# Altium project Brendon_STM32-v1.1.PrjPcb (part 2 of 2)

## Sheet Peripheral_Sheet.SchDoc
size A4; DocumentNumber: 4; SheetNumber: 4; SheetTotal: 4
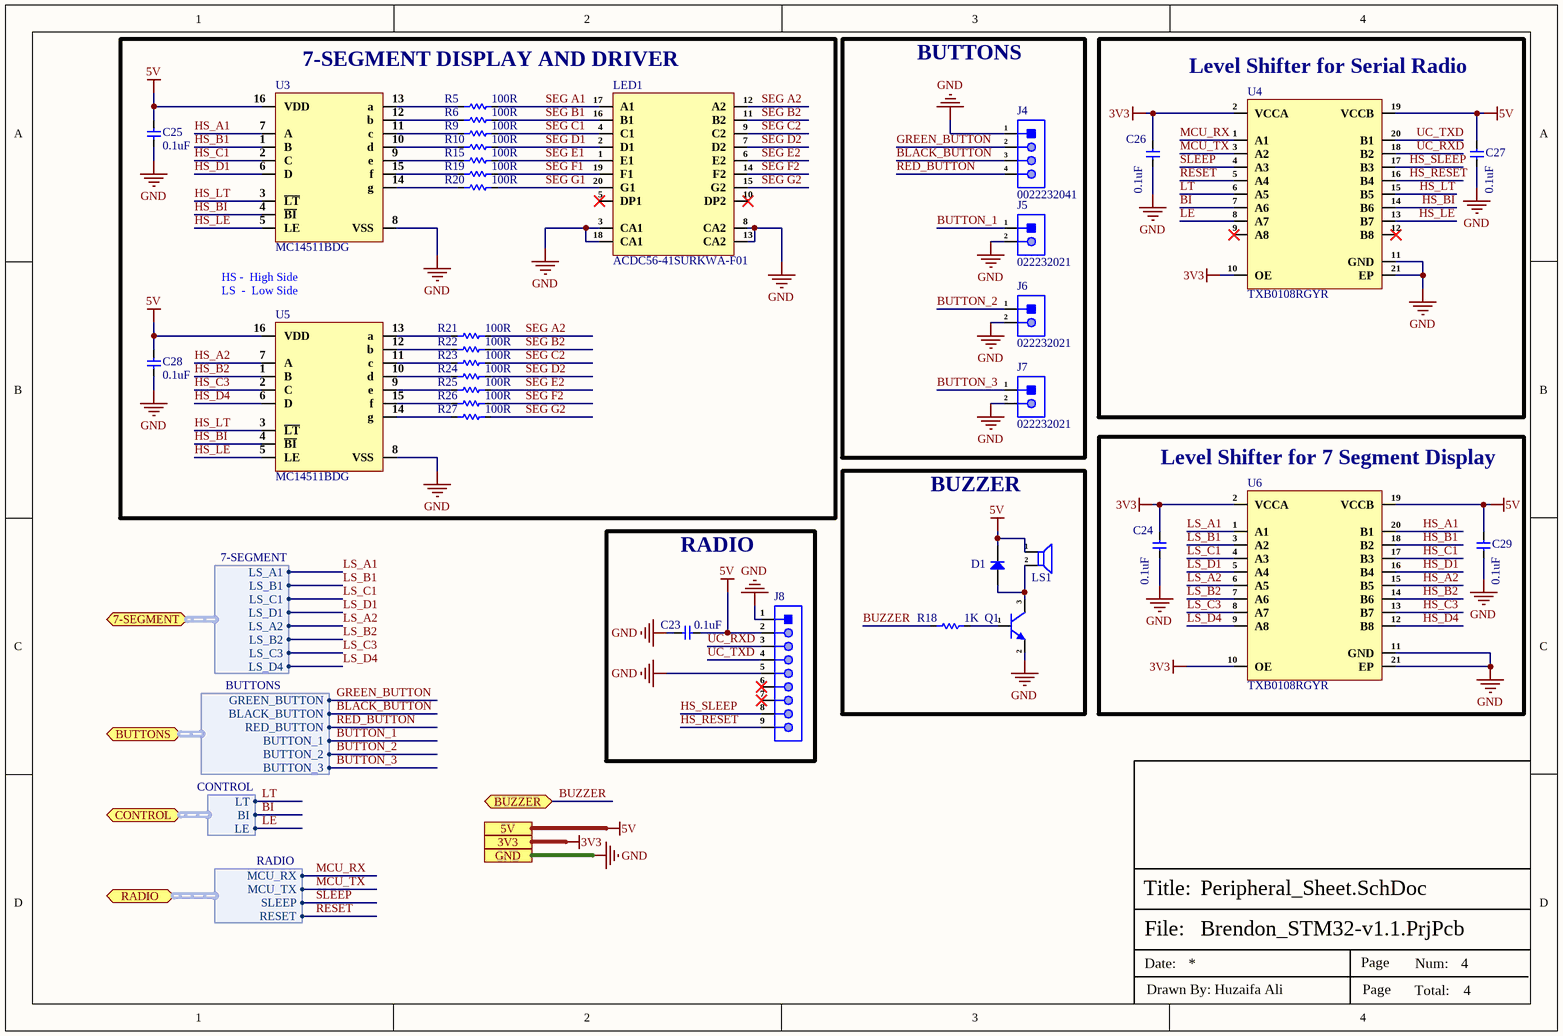
[diagram p2: Peripheral_Sheet.SchDoc]

### Parts
C23  0.1uF  [Cap-0805]
C24  0.1uF  [Cap-0805]
C25  0.1uF  [Cap-0805]
C26  0.1uF  [Cap-0805]
C27  0.1uF  [Cap-0805]
C28  0.1uF  [Cap-0805]
C29  0.1uF  [Cap-0805]
D1  MURS120-E3/5BT  [DO-214AA (SMB)]  (value not drawn)
J4  0022232041  [0022232041]
J5  022232021  [022232021]
J6  022232021  [022232021]
J7  022232021  [022232021]
J8  PPTC091LGBN-RC  [HDR 1x9 Female R/A]  (value not drawn)
LED1  ACDC56-41SURKWA-F01  [ACDC56-41SURKWA-F01]
LS1  CT-1205CL-SMT-TR  [CT-1205CL-SMT-TR]  (value not drawn)
Q1  BC849C-TP  [SOT-23]  (value not drawn)
R5  100R  [Res-0603]
R6  100R  [Res-0603]
R9  100R  [Res-0603]
R10  100R  [Res-0603]
R15  100R  [Res-0603]
R18  1K  [RES-0805]
R19  100R  [Res-0603]
R20  100R  [Res-0603]
R21  100R  [Res-0603]
R22  100R  [Res-0603]
R23  100R  [Res-0603]
R24  100R  [Res-0603]
R25  100R  [Res-0603]
R26  100R  [Res-0603]
R27  100R  [Res-0603]
U3  MC14511BDG  [16-SOIC (0.154", 3.90mm Width)]
U4  TXB0108RGYR  [20-VFQFN Exposed Pad]
U5  MC14511BDG  [16-SOIC (0.154", 3.90mm Width)]
U6  TXB0108RGYR  [20-VFQFN Exposed Pad]

### Blocks framed on the sheet
7-SEGMENT DISPLAY AND DRIVER: C25 C28 LED1 R5 R6 R9 R10 R15 R19-R27 U3 U5
BUTTONS: J4-J7
Level Shifter for Serial Radio: C26 C27 U4
Level Shifter for 7 Segment Display: C24 C29 U6
BUZZER: D1 LS1 Q1 R18
RADIO: C23 J8

### Ports
3V3 (see Top_Sheet[3B], Controller_Sheet[1D], Power_Sheet[1C]), 5V (see Top_Sheet[3B], Controller_Sheet[1D], Power_Sheet[1C]), 7-SEGMENT (bidir, harness 7-SEGMENT, see Top_Sheet[3B], Controller_Sheet[1C]), BUTTONS (bidir, harness BUTTONS, see Top_Sheet[3B], Controller_Sheet[1D]), BUZZER (bidir, see Top_Sheet[3C], Controller_Sheet[1D]), CONTROL (bidir, harness CONTROL, see Top_Sheet[3C], Controller_Sheet[1C]), GND (see Top_Sheet[3C], Controller_Sheet[1D], Power_Sheet[1C]), RADIO (bidir, harness RADIO, see Top_Sheet[3B], Controller_Sheet[1D])

### Harnesses
BUTTONS: GREEN_BUTTON, BLACK_BUTTON, RED_BUTTON, BUTTON_1, BUTTON_2, BUTTON_3
RADIO: MCU_RX, MCU_TX, SLEEP, RESET
7-SEGMENT: LS_A1, LS_B1, LS_C1, LS_D1, LS_A2, LS_B2, LS_C3, LS_D4
CONTROL: LT, BI, LE

### Nets
3V3: C24.2 C26.2 U4.2(VCCA) U4.10(OE) U6.2(VCCA) U6.10(OE) ; port 3V3
5V: C23.1 C25.2 C27.2 C28.2 C29.2 D1.1(K) J8.2 LS1.1 U3.16(VDD) U4.19(VCCB) U5.16(VDD) U6.19(VCCB) ; port 5V
GND: C23.2 C24.1 C25.1 C26.1 C27.1 C28.1 C29.1 J4.1 J5.2 J6.2 J7.2 J8.1 J8.5 LED1.3(CA1) LED1.8(CA2) LED1.13(CA2) LED1.18(CA1) Q1.2(E) U3.8(VSS) U4.11(GND) U4.21(EP) U5.8(VSS) U6.11(GND) U6.21(EP) ; port GND
BI: U4.7(A6) ; port CONTROL.BI
BLACK_BUTTON: J4.3 ; port BUTTONS.BLACK_BUTTON
BUTTON_1: J5.1 ; port BUTTONS.BUTTON_1
BUTTON_2: J6.1 ; port BUTTONS.BUTTON_2
BUTTON_3: J7.1 ; port BUTTONS.BUTTON_3
BUZZER: R18.1 ; port BUZZER
GREEN_BUTTON: J4.2 ; port BUTTONS.GREEN_BUTTON
HS_A1: U3.7(A) U6.20(B1)
HS_A2: U5.7(A) U6.15(B5)
HS_B1: U3.1(B) U6.18(B2)
HS_B2: U5.1(B) U6.14(B6)
HS_BI: U3.4(~{BI}) U4.14(B6) U5.4(~{BI})
HS_C1: U3.2(C) U6.17(B3)
HS_C3: U5.2(C) U6.13(B7)
HS_D1: U3.6(D) U6.16(B4)
HS_D4: U5.6(D) U6.12(B8)
HS_LE: U3.5(LE) U4.13(B7) U5.5(LE)
HS_LT: U3.3(~{LT}) U4.15(B5) U5.3(~{LT})
HS_RESET: J8.9 U4.16(B4)
HS_SLEEP: J8.8 U4.17(B3)
LE: U4.8(A7) ; port CONTROL.LE
LS_A1: U6.1(A1) ; port 7-SEGMENT.LS_A1
LS_A2: U6.6(A5) ; port 7-SEGMENT.LS_A2
LS_B1: U6.3(A2) ; port 7-SEGMENT.LS_B1
LS_B2: U6.7(A6) ; port 7-SEGMENT.LS_B2
LS_C1: U6.4(A3) ; port 7-SEGMENT.LS_C1
LS_C3: U6.8(A7) ; port 7-SEGMENT.LS_C3
LS_D1: U6.5(A4) ; port 7-SEGMENT.LS_D1
LS_D4: U6.9(A8) ; port 7-SEGMENT.LS_D4
LT: U4.6(A5) ; port CONTROL.LT
MCU_RX: U4.1(A1) ; port RADIO.MCU_RX
MCU_TX: U4.3(A2) ; port RADIO.MCU_TX
RED_BUTTON: J4.4 ; port BUTTONS.RED_BUTTON
RESET: U4.5(A4) ; port RADIO.RESET
SEG A1: LED1.17(A1) R5.2
SEG A2: LED1.12(A2) R21.2
SEG B1: LED1.16(B1) R6.2
SEG B2: LED1.11(B2) R22.2
SEG C1: LED1.4(C1) R9.2
SEG C2: LED1.9(C2) R23.2
SEG D1: LED1.2(D1) R10.2
SEG D2: LED1.7(D2) R24.2
SEG E1: LED1.1(E1) R15.2
SEG E2: LED1.6(E2) R25.2
SEG F1: LED1.19(F1) R19.2
SEG F2: LED1.14(F2) R26.2
SEG G1: LED1.20(G1) R20.2
SEG G2: LED1.15(G2) R27.2
SLEEP: U4.4(A3) ; port RADIO.SLEEP
UC_RXD: J8.3 U4.18(B2)
UC_TXD: J8.4 U4.20(B1)
NetD1_2: D1.2(A) LS1.2 Q1.3(C)
NetQ1_1: Q1.1(B) R18.2
NetR5_1: R5.1 U3.13(a)
NetR6_1: R6.1 U3.12(b)
NetR9_1: R9.1 U3.11(c)
NetR10_1: R10.1 U3.10(d)
NetR15_1: R15.1 U3.9(e)
NetR19_1: R19.1 U3.15(f)
NetR20_1: R20.1 U3.14(g)
NetR21_1: R21.1 U5.13(a)
NetR22_1: R22.1 U5.12(b)
NetR23_1: R23.1 U5.11(c)
NetR24_1: R24.1 U5.10(d)
NetR25_1: R25.1 U5.9(e)
NetR26_1: R26.1 U5.15(f)
NetR27_1: R27.1 U5.14(g)

Not connected (* = marked no-connect by the designer): J8 6* 7*; LED1 5(DP1)* 10(DP2)*; U4 9(A8)* 12(B8)*

### Notes on the sheet
- HS -  High Side
  LS  -  Low Side
- File:
- Title:
- Date:
- Page
- Num:
- Total:
- Drawn By: Huzaifa Ali

### Library data of the parts
C23-C29 = CL21B104KBCNNNC: Multilayer Ceramic Capacitor, 0.1 uF, 50 V, ± 10%, X7R, 0805 [2012 Metric]; Manufacturer: Samsung; Value: 100nF; Voltage Rating: 50V; Supplier: Digikey; Supplier Part Number: 1276-1003-1-ND; Manufacturer Part Number: CL21B104KBCNNNC; RoHS: Yes; Category: Ceramic Capacitors; Stock: 2193973; Pricing: 1=0.1, 10=0.042, 50=0.024, 100=0.0186, 500=0.01404, 1000=0.01103 (USD); Mounting Technology: Surface Mount; Case/Package: 0805; Case Code (Metric): 2012; Case Code (Imperial): 0805; Material: Ceramic; Min Operating Temperature: -55°C; Max Operating Temperature: 125°C; Tolerance: 10%; Dielectric: X7R; Packaging: Tape and Reel; Voltage: 50V; Series: CL; Construction: Flat; Voltage Rating (DC): 50V; Length: 2mm; Width: 0.049inch; Height: 0.85mm; Depth: 1.25mm; Thickness: 0.037inch; Radiation Hardening: No; RoHS Compliant: Yes; Lead Free: 5697LeadFree; ComponentLink1URL: https://datasheet.ciiva.com/25710/cl21b104kbcnnnc-25710182.pdf?src-supplier=Digikey; ComponentLink1Description: https://datasheet.ciiva.com/25710/cl21b104kbcnnnc-25710182.pdf?src-supplier=Digikey; ComponentLink2URL: https://datasheet.ciiva.com/29199/454152-da-01-en-vs-kondensator-0805-29199814.pdf?src-supplier=Conrad; ComponentLink2Description: https://datasheet.ciiva.com/29199/454152-da-01-en-vs-kondensator-0805-29199814.pdf?src-supplier=Conrad; Item Type: Capacitor
D1 = MURS120-E3/5BT: Rectifier Diode Switching 200V 2A 35ns 2-Pin SMB T/R; Manufacturer: Vishay Semiconductors; Max Reverse Current: 2uA; Max Surge Current: 40A; Current: 1A; Supplier: Digikey; Supplier Part Number: MURS120-E3/5BTGICT-ND; Manufacturer Part Number: MURS120-E3/5BT; RoHS: Yes; Category: Rectifier Diodes; Stock: 22917; Pricing: 1=0.44, 10=0.378, 100=0.2629, 500=0.20524, 1000=0.16682 (USD); Mounting Technology: Surface Mount; Case/Package: SMB; Pins: 2; Min Operating Temperature: -65°C; Max Operating Temperature: 175°C; Packaging: Tape and Reel; Forward Current: 2A; Package Quantity: 3200; Recovery Time: 35ns; Average Rectified Current: 2A; Reverse Recovery Time: 35ns; Max Repetitive Reverse Voltage (Vrrm): 200V; Peak Non-Repetitive Surge Current: 40A; Voltage: 200V; Reverse Voltage: 200V; Max Reverse Voltage (DC): 200V; Series: -; Radiation Hardening: No; RoHS Compliant: Yes; ComponentLink1URL: http://www.mouser.com/ds/2/427/88687-240345.pdf?src-supplier=Mouser; ComponentLink1Description: http://www.mouser.com/ds/2/427/88687-240345.pdf?src-supplier=Mouser; ComponentLink2URL: http://components.arrow.com/part/dataview/42678636S6900221N5680?src-supplier=Arrow+Electronics; ComponentLink2Description: http://components.arrow.com/part/dataview/42678636S6900221N5680?src-supplier=Arrow+Electronics; ComponentLink3URL: http://www.vishay.com/docs/88687/murs120.pdf?src-supplier=Digikey; ComponentLink3Description: http://www.vishay.com/docs/88687/murs120.pdf?src-supplier=Digikey; ComponentLink4URL: http://www.vishay.com/docs/88687/88687.pdf?src-supplier=Avnet; ComponentLink4Description: http://www.vishay.com/docs/88687/88687.pdf?src-supplier=Avnet; Package: DO-214AA (SMB); Item Type: Diode
J4 = 0022232041: CONN HEADER VERT 4POS 2.54MM; Manufacturer: Molex; Item Type: JST Connector; Supplier: Mouser; Supplier Part Number: 538-22-23-2041; Manufacturer Part Number: 0022232041; RoHS: Yes; Stock: 47281; Pricing: 1=0.33, 10=0.215, 50=0.215, 100=0.16, 1000=0.145, 10000=0.13 (USD)
J5-J7 = 022232021: CONN HEADER VERT 2POS 2.54MM; Manufacturer: Molex; Supplier: Mouser; Supplier Part Number: 538-22-23-2021; Manufacturer Part Number: 022232021; RoHS: No; Category: Uncategorized; Stock: 51848; Pricing: 1=0.21, 10=0.127, 50=0.127, 100=0.096, 1000=0.086, 10000=0.073 (USD)
J8 = PPTC091LGBN-RC: CONN HDR 9POS 0.1 TIN PCB R/A; Manufacturer: Sullins; Number of Positions: 9; Connector Type: Header; Voltage Rating: 250V; Item Type: Female Header R/A; Supplier: Digikey; Supplier Part Number: S5445-ND; Manufacturer Part Number: PPTC091LGBN-RC; RoHS: Yes; Category: Headers and Wire Housings; Stock: 254; Pricing: 1=0.74, 10=0.624, 80=0.5605, 440=0.45864, 1000=0.40768, 5000=0.364 (USD); Mounting Technology: Through Hole; Contact Material: Bronze; Housing Color: Black; Housing Material: Plastic; Contact Finish - Mating: TIN; Insulation Color: Black; Insulation Material: Polyester; Contact Shape: Square; Min Operating Temperature: -40°C; Max Operating Temperature: 105°C; Number of Rows: 1; Packaging: Tray; Termination: Solder; Contact Type: Female Socket; Fastening Type: Pull; Series: -; Length: 23.4mm; Width: 8.5mm; Height: 2.4mm; Lead Free: Lead Free; RoHS Compliant: Yes; Flammability Rating: UL94 V-0; ComponentLink1URL: https://media.digikey.com/pdf/Data%20Sheets/Sullins%20PDFs/Female_Headers.100_DS.pdf?src-supplier=Digikey; ComponentLink1Description: https://media.digikey.com/pdf/Data%20Sheets/Sullins%20PDFs/Female_Headers.100_DS.pdf?src-supplier=Digikey
LED1 = ACDC56-41SURKWA-F01: DISPLAY 7SEG 0.56" DBL RED 20SMD; Manufacturer: Kingbright; Item Type: 7-Segment LED; Supplier: Digikey; Supplier Part Number: ACDC56-41SURKWA-F01-ND; Manufacturer Part Number: ACDC56-41SURKWA-F01; RoHS: Yes; Category: LED Displays; Pricing: 2000=2.31795 (USD); ComponentLink1URL: https://datasheet.ciiva.com/12423/acdc56-41surkwa-f01-81627-12423377.pdf?src-supplier=Mouser; ComponentLink1Description: https://datasheet.ciiva.com/12423/acdc56-41surkwa-f01-81627-12423377.pdf?src-supplier=Mouser; ComponentLink2URL: https://datasheet.ciiva.com/2105/acdc56-41surkwa-f01-2105135.pdf?src-supplier=Digikey; ComponentLink2Description: https://datasheet.ciiva.com/2105/acdc56-41surkwa-f01-2105135.pdf?src-supplier=Digikey
LS1 = CT-1205CL-SMT-TR: 12.8 mm, 5 V, 88 dB, 2.4 kHz, Surface Mount (SMT), Driving Circuit, Magnetic Audio Indicator Buzzer; Manufacturer: CUI; Frequency: 2.4kHz; Voltage Rating: 5V; Operating Supply Current: 30mA; Supplier: Digikey; Supplier Part Number: 102-1267-1-ND; Manufacturer Part Number: CT-1205CL-SMT-TR; RoHS: No; Category: Uncategorized; Stock: 58213; Pricing: 1=2.230000, 10=1.848000, 25=1.706400, 50=1.603400, 100=1.504100 (USD); Mounting Technology: Surface Mount; Case/Package: SMD/SMT; Min Operating Temperature: -30°C; Max Operating Temperature: 70°C; Termination: Solder; Package Quantity: 450; Packaging: Tape and Reel; Sensing Method: Magnetic; Length: 12.8mm; Width: 12.8mm; Height: 7.6mm; Lead Free: Lead Free; ComponentLink1URL: http://www.mouser.com/ds/2/670/ct-1205cl-smt-515776.pdf?src-supplier=Mouser; ComponentLink1Description: http://www.mouser.com/ds/2/670/ct-1205cl-smt-515776.pdf?src-supplier=Mouser; ComponentLink2URL: https://www.cui.com/product/resource/digikeypdf/ct-1205cl-smt.pdf?src-supplier=Digikey; ComponentLink2Description: https://www.cui.com/product/resource/digikeypdf/ct-1205cl-smt.pdf?src-supplier=Digikey
Q1 = BC849C-TP: TRANS NPN 30V 0.1A SOT23; Manufacturer: MCC; Frequency: 100MHz; Max Power Dissipation: 225mW; Max Collector Current: 100mA; Emitter Base Voltage (VEBO): 6V; Number of Elements: 1; Collector-emitter Voltage-Max: 500mV; Item Type: Mosfet; Supplier: Arrow Electronics; Supplier Part Number: BC849C-TP; Manufacturer Part Number: BC849C-TP; RoHS: Yes; Category: BJTs; Stock: 3000; Pricing: 3000=0.0323, 9000=0.0245, 24000=0.0235, 45000=0.0216, 99000=0.0186 (USD); Mounting Technology: Surface Mount; Case/Package: SOT-23; Pins: 3; Min Operating Temperature: -55°C; Max Operating Temperature: 150°C; Package Quantity: 1; Collector Emitter Voltage (VCEO): 30V; Packaging: Tape and Reel; Transition Frequency: 100MHz; Collector Emitter Breakdown Voltage: 30V; Max Breakdown Voltage: 30V; Polarity: NPN; Collector Base Voltage (VCBO): 30V; Power Dissipation: 225mW; Gain Bandwidth Product: 100MHz; Series: BC849; Radiation Hardening: No; Lead Free: Lead Free; RoHS Compliant: Yes; Reach SVHC Compliant: Unknown; ComponentLink1URL: https://datasheet.ciiva.com/6362/bc846a-bc849csot-23-6362344.pdf?src-supplier=Digikey; ComponentLink1Description: https://datasheet.ciiva.com/6362/bc846a-bc849csot-23-6362344.pdf?src-supplier=Digikey; ComponentLink2URL: https://datasheet.ciiva.com/6362/bc846a-bc849csot-23-6362345.pdf?src-supplier=Digikey; ComponentLink2Description: https://datasheet.ciiva.com/6362/bc846a-bc849csot-23-6362345.pdf?src-supplier=Digikey; ComponentLink3URL: https://datasheet.ciiva.com/6362/bc846a-bc849csot-23-6362342.pdf?src-supplier=Digikey; ComponentLink3Description: https://datasheet.ciiva.com/6362/bc846a-bc849csot-23-6362342.pdf?src-supplier=Digikey; ComponentLink4URL: https://datasheet.ciiva.com/15200/getdatasheetpartid-334290-15200455.pdf?src-supplier=Verical; ComponentLink4Description: https://datasheet.ciiva.com/15200/getdatasheetpartid-334290-15200455.pdf?src-supplier=Verical
R5 R6 R9 R10 R15 R19-R27 = RC0603FR-07100RL: RES SMD 100 OHM 1% 1/10W 0603; Manufacturer: Yageo; Temperature Coefficient: 100ppm/°C; Voltage Rating (DC): 50V; Power Rating: 100mW; Item Type: Resistor; Supplier 1: Arrow Electronics; Manufacturer Part Number: RC0603FR-07100RL; RoHS: Yes; Category: Chip SMD Resistors; Stock 1: 3800000; Pricing 1: 5000=0.00300, 5000=0.00200, 5000=0.00450, 50000=0.00410, 500000=0.00230, 2500000=0.00140 (USD); Case/Package: 0603; Number of Pins: 2; Case Code (Imperial): 0603; Case Code (Metric): 1608; Size Code: 0603; Min Operating Temperature: -55°C; Max Operating Temperature: 155°C; Resistance: 100R; Tolerance: 1%; Resistor Type: Thick Film; Packaging: Tape and Reel; Voltage Rating: 50V; Termination: SMD/SMT; Features: Moisture Resistant; Series: RC; Max Power Dissipation: 100mW; Number of Terminations: 2; Construction: Rectangular; Resistance Tolerance: 1%; Technology: THICK FILM; Length: 1.6mm; Width: 0.8mm; Height: 0.45mm; Depth: 0.8mm; REACH SVHC: Unknown; Lead Free: Lead Free; RoHS Compliant: Yes; Military Standard: Not; Supplier Part Number 1: RC0603FR-07100RL; LCSC Part Number: C105588
R18 = RC0805FR-071KL: RES 1K OHM 1% 1/8W 0805; Manufacturer: Yageo; Value: 1kR; Voltage Rating (DC): 150V; Temperature Coefficient: 100ppm/°C; Power Rating: 125mW; Item Type: Resistor; Supplier: Future Electronics; Supplier Part Number: 8126013; Manufacturer Part Number: RC0805FR-071KL; RoHS: Yes; Category: Chip SMD Resistors; Stock: 8305000; Pricing: 5000=0.117, 25000=0.112, 125000=0.107, 500000=0.104, 1250000=0.0981 (USD); Case/Package: 0805; Pins: 2; Case Code (Metric): 2012; Case Code (Imperial): 0805; Min Operating Temperature: -55°C; Max Operating Temperature: 155°C; Tolerance: 1%; Packaging: Tape and Reel; Resistor Type: Thick Film; Package Quantity: 1; Voltage Rating: 150V; Termination: SMD/SMT; Series: RC; Number of Terminations: 2; Max Power Dissipation: 125mW; Features: Moisture Resistant; Resistance Tolerance: 1%; Construction: Rectangular; Voltage Rating (AC): 150V; Length: 0.079inch; Width: 0.049inch; Height: 0.024inch; Depth: 1.25mm; Reach SVHC Compliant: No; Lead Free: 5697LeadFree; RoHS Compliant: Yes; Military Standard: Not; ComponentLink1URL: https://datasheet.ciiva.com/7941/1686128-7941719.pdf?src-supplier=Element14; ComponentLink1Description: https://datasheet.ciiva.com/7941/1686128-7941719.pdf?src-supplier=Element14; ComponentLink2URL: https://datasheet.ciiva.com/46385/444164-46385020.pdf?src-supplier=Element14; ComponentLink2Description: https://datasheet.ciiva.com/46385/444164-46385020.pdf?src-supplier=Element14; ComponentLink3URL: https://datasheet.ciiva.com/2456/pyu-r-int-thick-7-2456976.pdf?src-supplier=Digi-Key; ComponentLink3Description: https://datasheet.ciiva.com/2456/pyu-r-int-thick-7-2456976.pdf?src-supplier=Digi-Key; ComponentLink4URL: https://datasheet.ciiva.com/2456/pyu-r-int-thick-7-2456977.pdf?src-supplier=Digi-Key; ComponentLink4Description: https://datasheet.ciiva.com/2456/pyu-r-int-thick-7-2456977.pdf?src-supplier=Digi-Key; ComponentLink5URL: https://datasheet.ciiva.com/2456/pyu-r-int-thick-7-2456975.pdf?src-supplier=Digi-Key; ComponentLink5Description: https://datasheet.ciiva.com/2456/pyu-r-int-thick-7-2456975.pdf?src-supplier=Digi-Key; ComponentLink6URL: https://datasheet.ciiva.com/16850/rc0805-16850409.pdf?src-supplier=Future+Electronics; ComponentLink6Description: https://datasheet.ciiva.com/16850/rc0805-16850409.pdf?src-supplier=Future+Electronics; LCSC Part Number: C95781
U3 U5 = MC14511BDG: MC14511BDG; Decoder; Driver; Latch; Non-Inverting; 3 - 18 V; 16-Pin SOIC; Manufacturer: ON Semiconductor; Number of Channels: 1NUMBER; Item Type: IC; Supplier: Digikey; Supplier Part Number: MC14511BDGOS-ND; Manufacturer Part Number: MC14511BDG; RoHS: Yes; Category: Latches and Flip Flops; Stock: 462; Pricing: 1=0.87, 10=0.78, 48=0.74042, 144=0.56847, 288=0.5024, 528=0.47595, 1008=0.37019, 2544=0.35167, 5040=0.33845 (USD); ComponentLink1URL: https://datasheet.ciiva.com/15092/getdatasheetpartid-72059-15092223.pdf?src-supplier=Verical; ComponentLink1Description: https://datasheet.ciiva.com/15092/getdatasheetpartid-72059-15092223.pdf?src-supplier=Verical; ComponentLink2URL: https://datasheet.ciiva.com/8251/mc14511b-d-8251726.pdf?src-supplier=Avnet; ComponentLink2Description: https://datasheet.ciiva.com/8251/mc14511b-d-8251726.pdf?src-supplier=Avnet; ComponentLink3URL: https://datasheet.ciiva.com/1940/mc14511b-d-1940500.pdf?src-supplier=Digikey; ComponentLink3Description: https://datasheet.ciiva.com/1940/mc14511b-d-1940500.pdf?src-supplier=Digikey; ComponentLink4URL: https://datasheet.ciiva.com/16446/mc14511b-d-16446076.pdf?src-supplier=Future+Electronics; ComponentLink4Description: https://datasheet.ciiva.com/16446/mc14511b-d-16446076.pdf?src-supplier=Future+Electronics; LCSC Part Number: C906828; ComponentLink5Description: LCSC; ComponentLink5URL: https://www.lcsc.com/product-detail/Signal-Switches-Encoders-Decoders-Multiplexers_onsemi-MC14511BDG_C906828.html
U4 U6 = TXB0108RGYR: IC 8-BIT TRNSLTR 15KV ESD 20VQFN; Manufacturer: Texas Instruments; Supplier: Digikey; Supplier Part Number: 296-21528-1-ND; Manufacturer Part Number: TXB0108RGYR; RoHS: Yes; Category: Voltage Level Shifters; Stock: 3013; Pricing: 1=1.55, 10=1.394, 25=1.3156, 100=1.1208, 250=1.0524, 500=0.92086, 1000=0.763 (USD); ComponentLink1URL: https://datasheet.ciiva.com/15096/getdatasheetpartid-172984-15096214.pdf?src-supplier=Verical; ComponentLink1Description: https://datasheet.ciiva.com/15096/getdatasheetpartid-172984-15096214.pdf?src-supplier=Verical; ComponentLink2URL: https://datasheet.ciiva.com/1899/txb0108-1899601.pdf?src-supplier=Digikey; ComponentLink2Description: https://datasheet.ciiva.com/1899/txb0108-1899601.pdf?src-supplier=Digikey; ComponentLink3URL: https://datasheet.ciiva.com/1899/txb0108-1899602.pdf?src-supplier=Digikey; ComponentLink3Description: https://datasheet.ciiva.com/1899/txb0108-1899602.pdf?src-supplier=Digikey; ComponentLink4URL: https://datasheet.ciiva.com/1899/txb0108-1899603.pdf?src-supplier=Digikey; ComponentLink4Description: https://datasheet.ciiva.com/1899/txb0108-1899603.pdf?src-supplier=Digikey; ComponentLink5URL: https://datasheet.ciiva.com/1508/1811182-1508728.pdf?src-supplier=Element14; ComponentLink5Description: https://datasheet.ciiva.com/1508/1811182-1508728.pdf?src-supplier=Element14

## Sheet Power_Sheet.SchDoc
size A4; DocumentNumber: 2; SheetNumber: 2; SheetTotal: 4
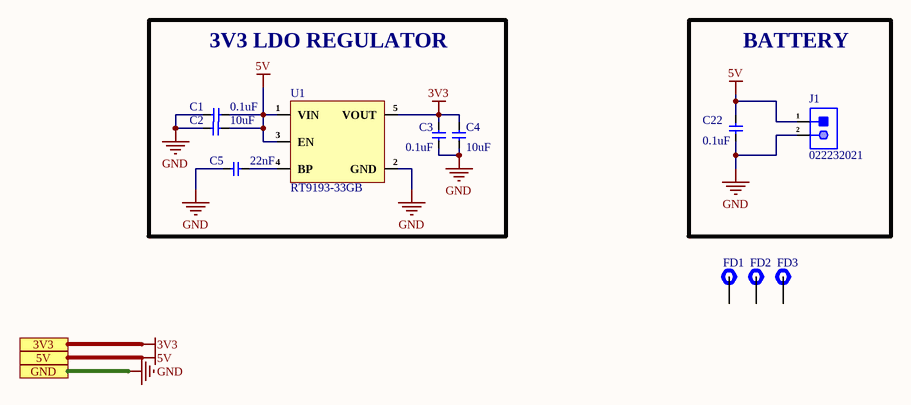
[diagram p3: Power_Sheet.SchDoc]

### Parts
C1  0.1uF  [Cap-0805]
C2  10uF  [Cap-0805]
C3  0.1uF  [Cap-0805]
C4  10uF  [Cap-0805]
C5  22nF  [Cap-0805]
C22  0.1uF  [Cap-0805]
FD1  Fiducial Mark  [Fiducial mark]  (value not drawn)
FD2  Fiducial Mark  [Fiducial mark]  (value not drawn)
FD3  Fiducial Mark  [Fiducial mark]  (value not drawn)
J1  022232021  [022232021]
U1  RT9193-33GB  [SOT-23-5]

### Blocks framed on the sheet
3V3 LDO REGULATOR: C1-C5 U1
BATTERY: C22 J1

### Ports
3V3 (see Top_Sheet[1B], Controller_Sheet[1D], Peripheral_Sheet[2D]), 5V (see Top_Sheet[1B], Controller_Sheet[1D], Peripheral_Sheet[2D]), GND (see Top_Sheet[2B], Controller_Sheet[1D], Peripheral_Sheet[2D])

### Nets
3V3: C3.2 C4.2 U1.5(VOUT) ; port 3V3
5V: C1.1 C2.2 C22.2 J1.1 U1.1(VIN) U1.3(EN) ; port 5V
GND: C1.2 C2.1 C3.1 C4.1 C5.1 C22.1 J1.2 U1.2(GND) ; port GND
NetC5_2: C5.2 U1.4(BP)

Not connected (* = marked no-connect by the designer): FD1 1; FD2 1; FD3 1

### Notes on the sheet
- File:
- Title:
- Date:
- Page
- Num:
- Total:
- Drawn By: Huzaifa Ali

### Library data of the parts
C1 C3 C22 = CL21B104KBCNNNC: as C23 on sheet Peripheral_Sheet; Supplier: Digikey; Supplier Part Number: 1276-1003-1-ND; Manufacturer Part Number: CL21B104KBCNNNC; RoHS: Yes; Category: Ceramic Capacitors; Stock: 2193973; Pricing: 1=0.1, 10=0.042, 50=0.024, 100=0.0186, 500=0.01404, 1000=0.01103 (USD); Mounting Technology: Surface Mount; Case/Package: 0805; Case Code (Metric): 2012; Case Code (Imperial): 0805; Material: Ceramic; Min Operating Temperature: -55°C; Max Operating Temperature: 125°C; Tolerance: 10%; Dielectric: X7R; Packaging: Tape and Reel; Voltage: 50V; Series: CL; Construction: Flat; Voltage Rating (DC): 50V; Length: 2mm; Width: 0.049inch; Height: 0.85mm; Depth: 1.25mm; Thickness: 0.037inch; Radiation Hardening: No; RoHS Compliant: Yes; Lead Free: 5697LeadFree; ComponentLink1URL: https://datasheet.ciiva.com/25710/cl21b104kbcnnnc-25710182.pdf?src-supplier=Digikey; ComponentLink1Description: https://datasheet.ciiva.com/25710/cl21b104kbcnnnc-25710182.pdf?src-supplier=Digikey; ComponentLink2URL: https://datasheet.ciiva.com/29199/454152-da-01-en-vs-kondensator-0805-29199814.pdf?src-supplier=Conrad; ComponentLink2Description: https://datasheet.ciiva.com/29199/454152-da-01-en-vs-kondensator-0805-29199814.pdf?src-supplier=Conrad; Item Type: Capacitor
C2 C4 = CL21A106KOQNNNE: Multilayer Ceramic Capacitor, 10 uF, 16 V, ± 10%, X5R, 0805 [2012 Metric]; Manufacturer: Samsung; Voltage Rating: 16V; Dielectric: X7R; Supplier: Digikey; Supplier Part Number: 1276-1096-1-ND; Manufacturer Part Number: CL21A106KOQNNNE; RoHS: Yes; Category: Ceramic Capacitors; Stock: 4169901; Pricing: 1=0.1, 10=0.07, 50=0.0404, 100=0.0313, 500=0.02354, 1000=0.0185 (USD); Mounting Technology: Surface Mount; Case/Package: 0805; Material: Ceramic; Case Code (Metric): 2012; Case Code (Imperial): 0805; Min Operating Temperature: -55°C; Max Operating Temperature: 85°C; Package Quantity: 1; Packaging: Tape and Reel; Value: 10uF; Tolerance: 10%; Voltage Rating (DC): 16V; Voltage: 16V; Series: CL; Construction: Flat; Length: 2mm; Width: 0.049inch; Height: 1.25mm; Thickness: 0.055inch; Depth: 1.25mm; Radiation Hardening: No; Lead Free: Lead Free; RoHS Compliant: Yes; ComponentLink1URL: https://datasheet.ciiva.com/25798/cl21a106koqnnne-25798133.pdf?src-supplier=Digikey; ComponentLink1Description: https://datasheet.ciiva.com/25798/cl21a106koqnnne-25798133.pdf?src-supplier=Digikey; Item Type: Capacitor; Package: 0805; LCSC Part Number: C1713
C5 = CL21B223KBANNNC: Multilayer Ceramic Capacitor, 0.022 uF, 50 V, ± 10%, X7R, 0805 [2012 Metric]; Manufacturer: Samsung; Voltage: 50V; Supplier: Digikey; Supplier Part Number: 1276-1081-1-ND; Manufacturer Part Number: CL21B223KBANNNC; RoHS: Yes; Category: Ceramic Capacitors; Stock: 135727; Pricing: 1=0.1, 10=0.032, 50=0.0184, 100=0.0143, 500=0.01074, 1000=0.00844 (USD); Mounting Technology: Surface Mount; Case/Package: 0805; Case Code (Metric): 2012; Case Code (Imperial): 0805; Material: Ceramic; Min Operating Temperature: -55°C; Max Operating Temperature: 125°C; Tolerance: 10%; Value: 22nF; Dielectric: X7R; Voltage Rating (DC): 50V; Packaging: Tape and Reel; Package Quantity: 1; Voltage Rating: 50V; Series: CL; Construction: Flat; Length: 2mm; Width: 0.049inch; Height: 0.65mm; Depth: 1.25mm; Thickness: 0.03inch; Radiation Hardening: No; Lead Free: Lead Free; RoHS Compliant: Yes; ComponentLink1URL: https://datasheet.ciiva.com/25800/cl21b223kbannnc-25800850.pdf?src-supplier=Digikey; ComponentLink1Description: https://datasheet.ciiva.com/25800/cl21b223kbannnc-25800850.pdf?src-supplier=Digikey; ComponentLink2URL: https://datasheet.ciiva.com/26838/getdatasheetpartid-498011-26838697.pdf?src-supplier=Verical; ComponentLink2Description: https://datasheet.ciiva.com/26838/getdatasheetpartid-498011-26838697.pdf?src-supplier=Verical; ComponentLink3URL: https://datasheet.ciiva.com/29199/454724-da-01-en-vs-kondensator-0805-29199517.pdf?src-supplier=Conrad; ComponentLink3Description: https://datasheet.ciiva.com/29199/454724-da-01-en-vs-kondensator-0805-29199517.pdf?src-supplier=Conrad; Item Type: Capacitor; Package: 0805; LCSC Part Number: C1729
J1 = 022232021: as J5 on sheet Peripheral_Sheet; Supplier: Mouser; Supplier Part Number: 538-22-23-2021; Manufacturer Part Number: 022232021; RoHS: No; Category: Uncategorized; Stock: 51848; Pricing: 1=0.21, 10=0.127, 50=0.127, 100=0.096, 1000=0.086, 10000=0.073 (USD)
U1 = RT9193-33GB: IC REG LDO 3.3V 0.3A SOT23-5; Manufacturer: Richtek; Supplier: Digi-Key; Supplier Part Number: 1028-1014-1-ND; Manufacturer Part Number: RT9193-33GB; RoHS: Yes; Category: Voltage Regulators - Linear; Stock: 7748; Pricing: 1=0.53, 10=0.454, 25=0.424, 100=0.3394, 250=0.31512, 500=0.26664, 1000=0.20604 (USD); ComponentLink1URL: https://datasheet.ciiva.com/2046/3d3futf-83fb3frfm5mtkzlte2lnbkzg3d3d3f3d-2046896.pdf?src-supplier=Digi-Key; ComponentLink1Description: https://datasheet.ciiva.com/2046/3d3futf-83fb3frfm5mtkzlte2lnbkzg3d3d3f3d-2046896.pdf?src-supplier=Digi-Key; ComponentLink2URL: https://datasheet.ciiva.com/28652/1782157-28652989.pdf?src-supplier=Element14; ComponentLink2Description: https://datasheet.ciiva.com/28652/1782157-28652989.pdf?src-supplier=Element14

## Nets that join several sheets
3V3: Controller_Sheet (21 pins), Peripheral_Sheet (6 pins), Power_Sheet (C3.2 C4.2 U1.5)
5V: Controller_Sheet (Q2.2 R2.1), Peripheral_Sheet (12 pins), Power_Sheet (6 pins)
GND: Controller_Sheet (29 pins), Peripheral_Sheet (24 pins), Power_Sheet (8 pins)
BI: Controller_Sheet (U2.96), Peripheral_Sheet (U4.7)
BLACK_BUTTON: Controller_Sheet (U2.7), Peripheral_Sheet (J4.3)
BUTTON_1: Controller_Sheet (U2.38), Peripheral_Sheet (J5.1)
BUTTON_2: Controller_Sheet (U2.39), Peripheral_Sheet (J6.1)
BUTTON_3: Controller_Sheet (U2.40), Peripheral_Sheet (J7.1)
BUZZER: Controller_Sheet (U2.97), Peripheral_Sheet (R18.1)
GREEN_BUTTON: Controller_Sheet (U2.23), Peripheral_Sheet (J4.2)
LE: Controller_Sheet (U2.47), Peripheral_Sheet (U4.8)
LS_A1: Controller_Sheet (U2.35), Peripheral_Sheet (U6.1)
LS_A2: Controller_Sheet (U2.90), Peripheral_Sheet (U6.6)
LS_B1: Controller_Sheet (U2.36), Peripheral_Sheet (U6.3)
LS_B2: Controller_Sheet (U2.91), Peripheral_Sheet (U6.7)
LS_C1: Controller_Sheet (U2.37), Peripheral_Sheet (U6.4)
LS_C3: Controller_Sheet (U2.92), Peripheral_Sheet (U6.8)
LS_D1: Controller_Sheet (U2.89), Peripheral_Sheet (U6.5)
LS_D4: Controller_Sheet (U2.93), Peripheral_Sheet (U6.9)
LT: Controller_Sheet (U2.95), Peripheral_Sheet (U4.6)
MCU_RX: Controller_Sheet (U2.42), Peripheral_Sheet (U4.1)
MCU_TX: Controller_Sheet (U2.41), Peripheral_Sheet (U4.3)
RED_BUTTON: Controller_Sheet (U2.5), Peripheral_Sheet (J4.4)
RESET: Controller_Sheet (U2.1), Peripheral_Sheet (U4.5)
SLEEP: Controller_Sheet (U2.98), Peripheral_Sheet (U4.4)